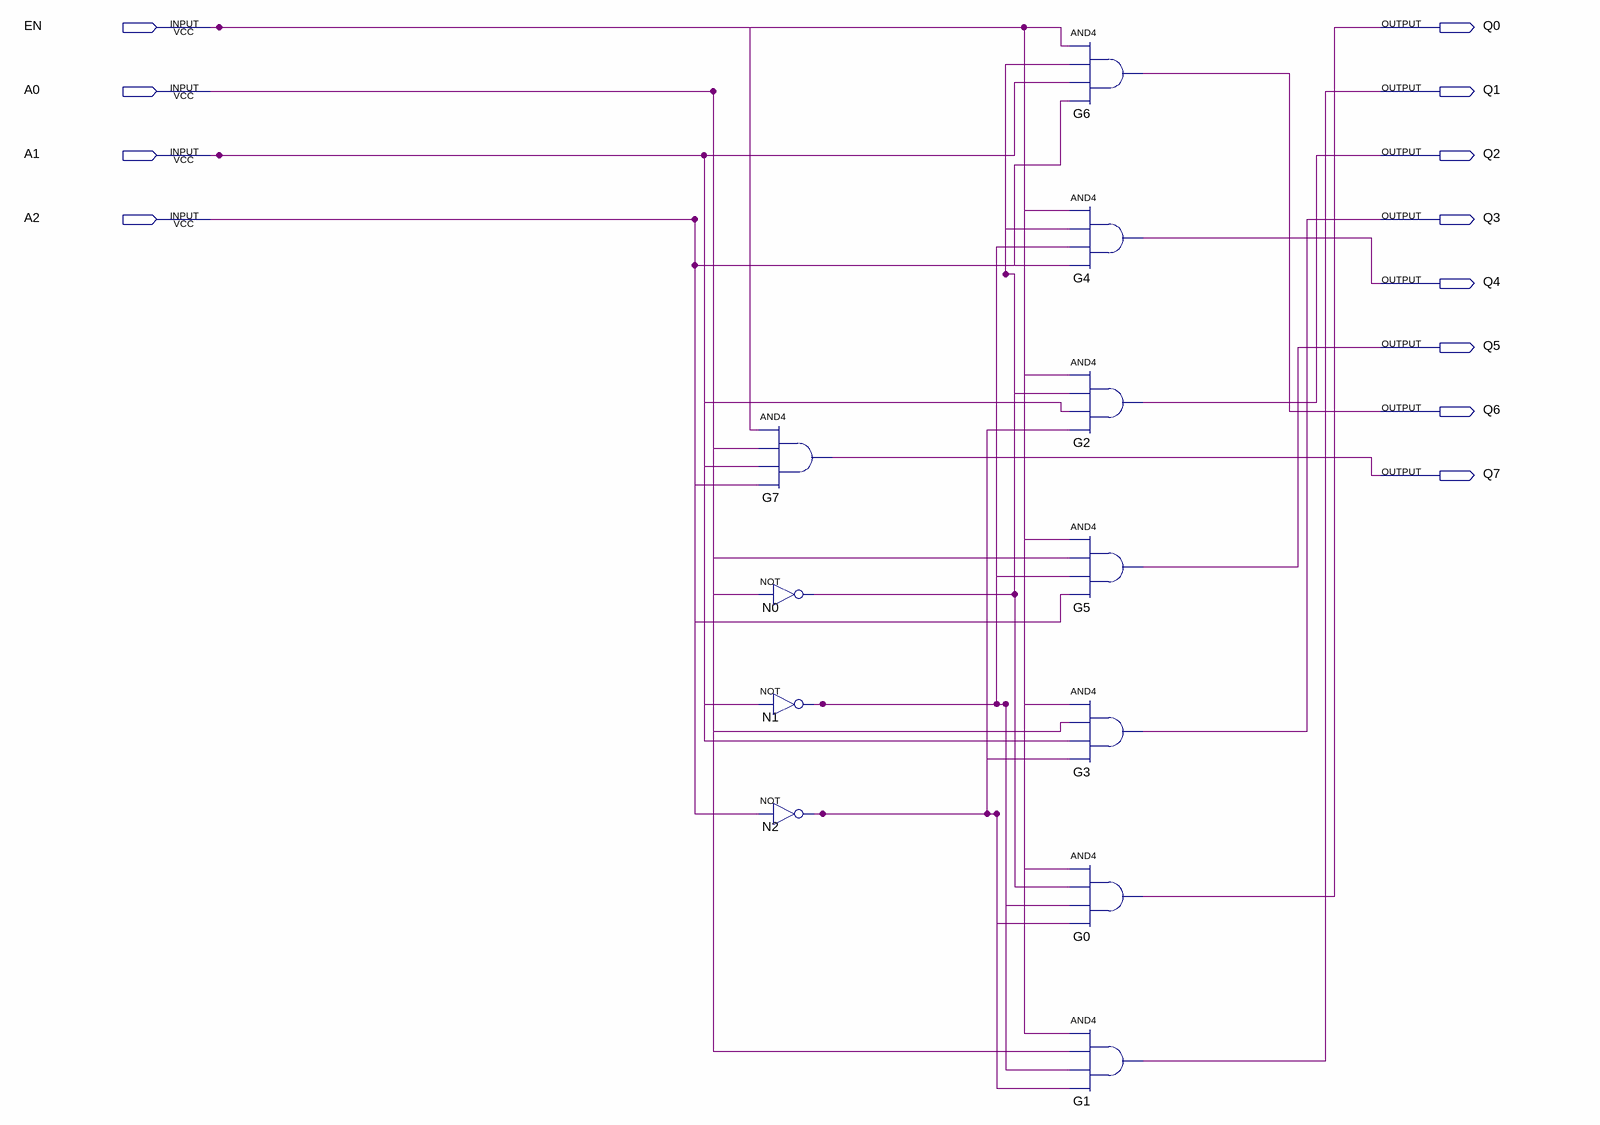
[diagram p0: schematic sheet]
// Quartus schematic decoder_3-8_en.bdf as structural Verilog: 11 symbols, 12 pins
module \decoder_3-8_en  (
  input  EN,
  input  A0,
  input  A1,
  input  A2,
  output Q0,
  output Q1,
  output Q2,
  output Q3,
  output Q4,
  output Q5,
  output Q6,
  output Q7
);

  wire N0_out, N1_out, N2_out;

  and G7 (Q7, EN, A0, A1, A2);
  not N0 (N0_out, A0);
  not N1 (N1_out, A1);
  not N2 (N2_out, A2);
  and G6 (Q6, EN, N0_out, A1, A2);
  and G4 (Q4, EN, N0_out, N1_out, A2);
  and G2 (Q2, EN, N0_out, A1, N2_out);
  and G5 (Q5, EN, A0, N1_out, A2);
  and G3 (Q3, EN, A0, A1, N2_out);
  and G0 (Q0, EN, N0_out, N1_out, N2_out);
  and G1 (Q1, EN, A0, N1_out, N2_out);
endmodule
